# Altium schematic sheet Top-Sheet.SchDoc
size A4; SheetNumber: 1; SheetTotal: 8
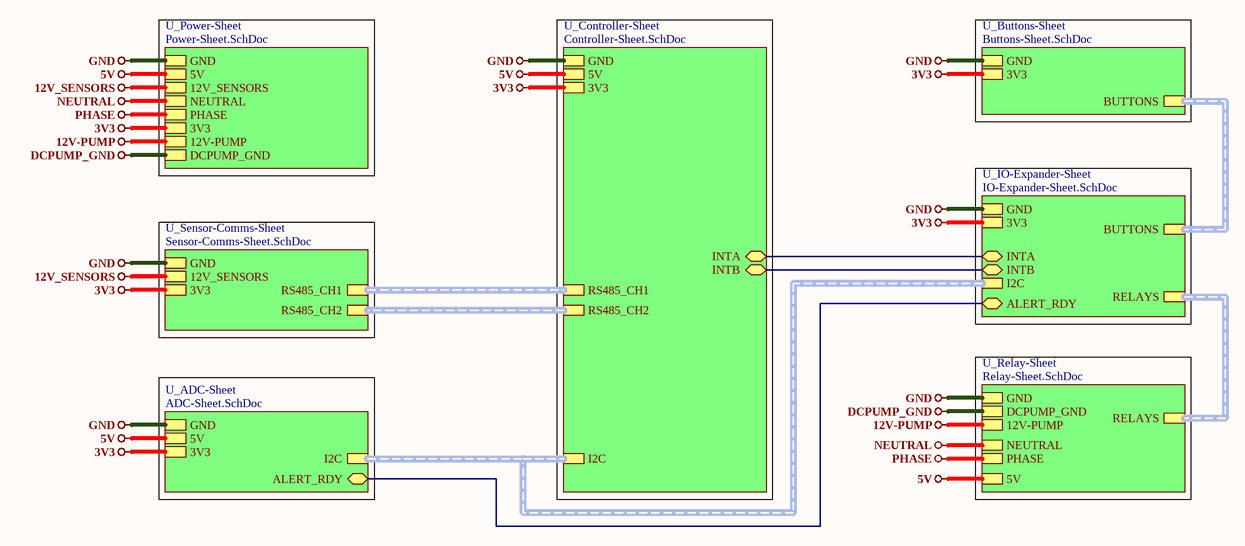
[diagram p0: Top-Sheet.SchDoc]

## Sub-sheets
U_ADC-Sheet = ADC-Sheet.SchDoc: GND, 5V, 3V3, ALERT_RDY (bidir), I2C (harness I2C)
U_Buttons-Sheet = Buttons-Sheet.SchDoc: GND, 3V3, BUTTONS (harness BUTTONS)
U_Controller-Sheet = Controller-Sheet.SchDoc: GND, 5V, 3V3, I2C (harness I2C), RS485_CH2 (harness RS485_CH2), RS485_CH1 (harness RS485_CH1), INTB (bidir), INTA (bidir)
U_IO-Expander-Sheet = IO-Expander-Sheet.SchDoc: GND, 3V3, BUTTONS (harness BUTTONS), ALERT_RDY (bidir), RELAYS (harness RELAYS), INTB (bidir), INTA (bidir), I2C (harness I2C)
U_Power-Sheet = Power-Sheet.SchDoc: GND, 5V, 12V_SENSORS, NEUTRAL, PHASE, 3V3, 12V-PUMP, DCPUMP_GND
U_Relay-Sheet = Relay-Sheet.SchDoc: RELAYS (harness RELAYS), GND, 5V, NEUTRAL, PHASE, 12V-PUMP, DCPUMP_GND
U_Sensor-Comms-Sheet = Sensor-Comms-Sheet.SchDoc: GND, 12V_SENSORS, 3V3, RS485_CH2 (harness RS485_CH2), RS485_CH1 (harness RS485_CH1)

## Nets
3V3: sheet U_Power-Sheet/3V3, sheet U_Sensor-Comms-Sheet/3V3, sheet U_ADC-Sheet/3V3, sheet U_Buttons-Sheet/3V3, sheet U_IO-Expander-Sheet/3V3, sheet U_Controller-Sheet/3V3
5V: sheet U_Power-Sheet/5V, sheet U_ADC-Sheet/5V, sheet U_Relay-Sheet/5V, sheet U_Controller-Sheet/5V
12V-PUMP: sheet U_Power-Sheet/12V-PUMP, sheet U_Relay-Sheet/12V-PUMP
12V_SENSORS: sheet U_Power-Sheet/12V_SENSORS, sheet U_Sensor-Comms-Sheet/12V_SENSORS
DCPUMP_GND: sheet U_Power-Sheet/DCPUMP_GND, sheet U_Relay-Sheet/DCPUMP_GND
GND: sheet U_Power-Sheet/GND, sheet U_Sensor-Comms-Sheet/GND, sheet U_ADC-Sheet/GND, sheet U_Buttons-Sheet/GND, sheet U_IO-Expander-Sheet/GND, sheet U_Relay-Sheet/GND, sheet U_Controller-Sheet/GND
NEUTRAL: sheet U_Power-Sheet/NEUTRAL, sheet U_Relay-Sheet/NEUTRAL
PHASE: sheet U_Power-Sheet/PHASE, sheet U_Relay-Sheet/PHASE
(unnamed): sheet U_ADC-Sheet/ALERT_RDY, sheet U_IO-Expander-Sheet/ALERT_RDY
(unnamed): sheet U_IO-Expander-Sheet/INTB, sheet U_Controller-Sheet/INTB
(unnamed): sheet U_IO-Expander-Sheet/INTA, sheet U_Controller-Sheet/INTA

## Buses and harness runs
harness sheet U_ADC-Sheet/I2C = sheet U_Controller-Sheet/I2C = sheet U_IO-Expander-Sheet/I2C
harness sheet U_Buttons-Sheet/BUTTONS = sheet U_IO-Expander-Sheet/BUTTONS
harness sheet U_Controller-Sheet/RS485_CH1 = sheet U_Sensor-Comms-Sheet/RS485_CH1
harness sheet U_Controller-Sheet/RS485_CH2 = sheet U_Sensor-Comms-Sheet/RS485_CH2
harness sheet U_IO-Expander-Sheet/RELAYS = sheet U_Relay-Sheet/RELAYS

## Notes on the sheet
- File:
- Title:
- Date:
- Page
- Num:
- Total:
- Drawn By: Huzaifa Ali